# EasyEDA Pro project Daaga1.3V.epro

# Schematic Daaga1.3V
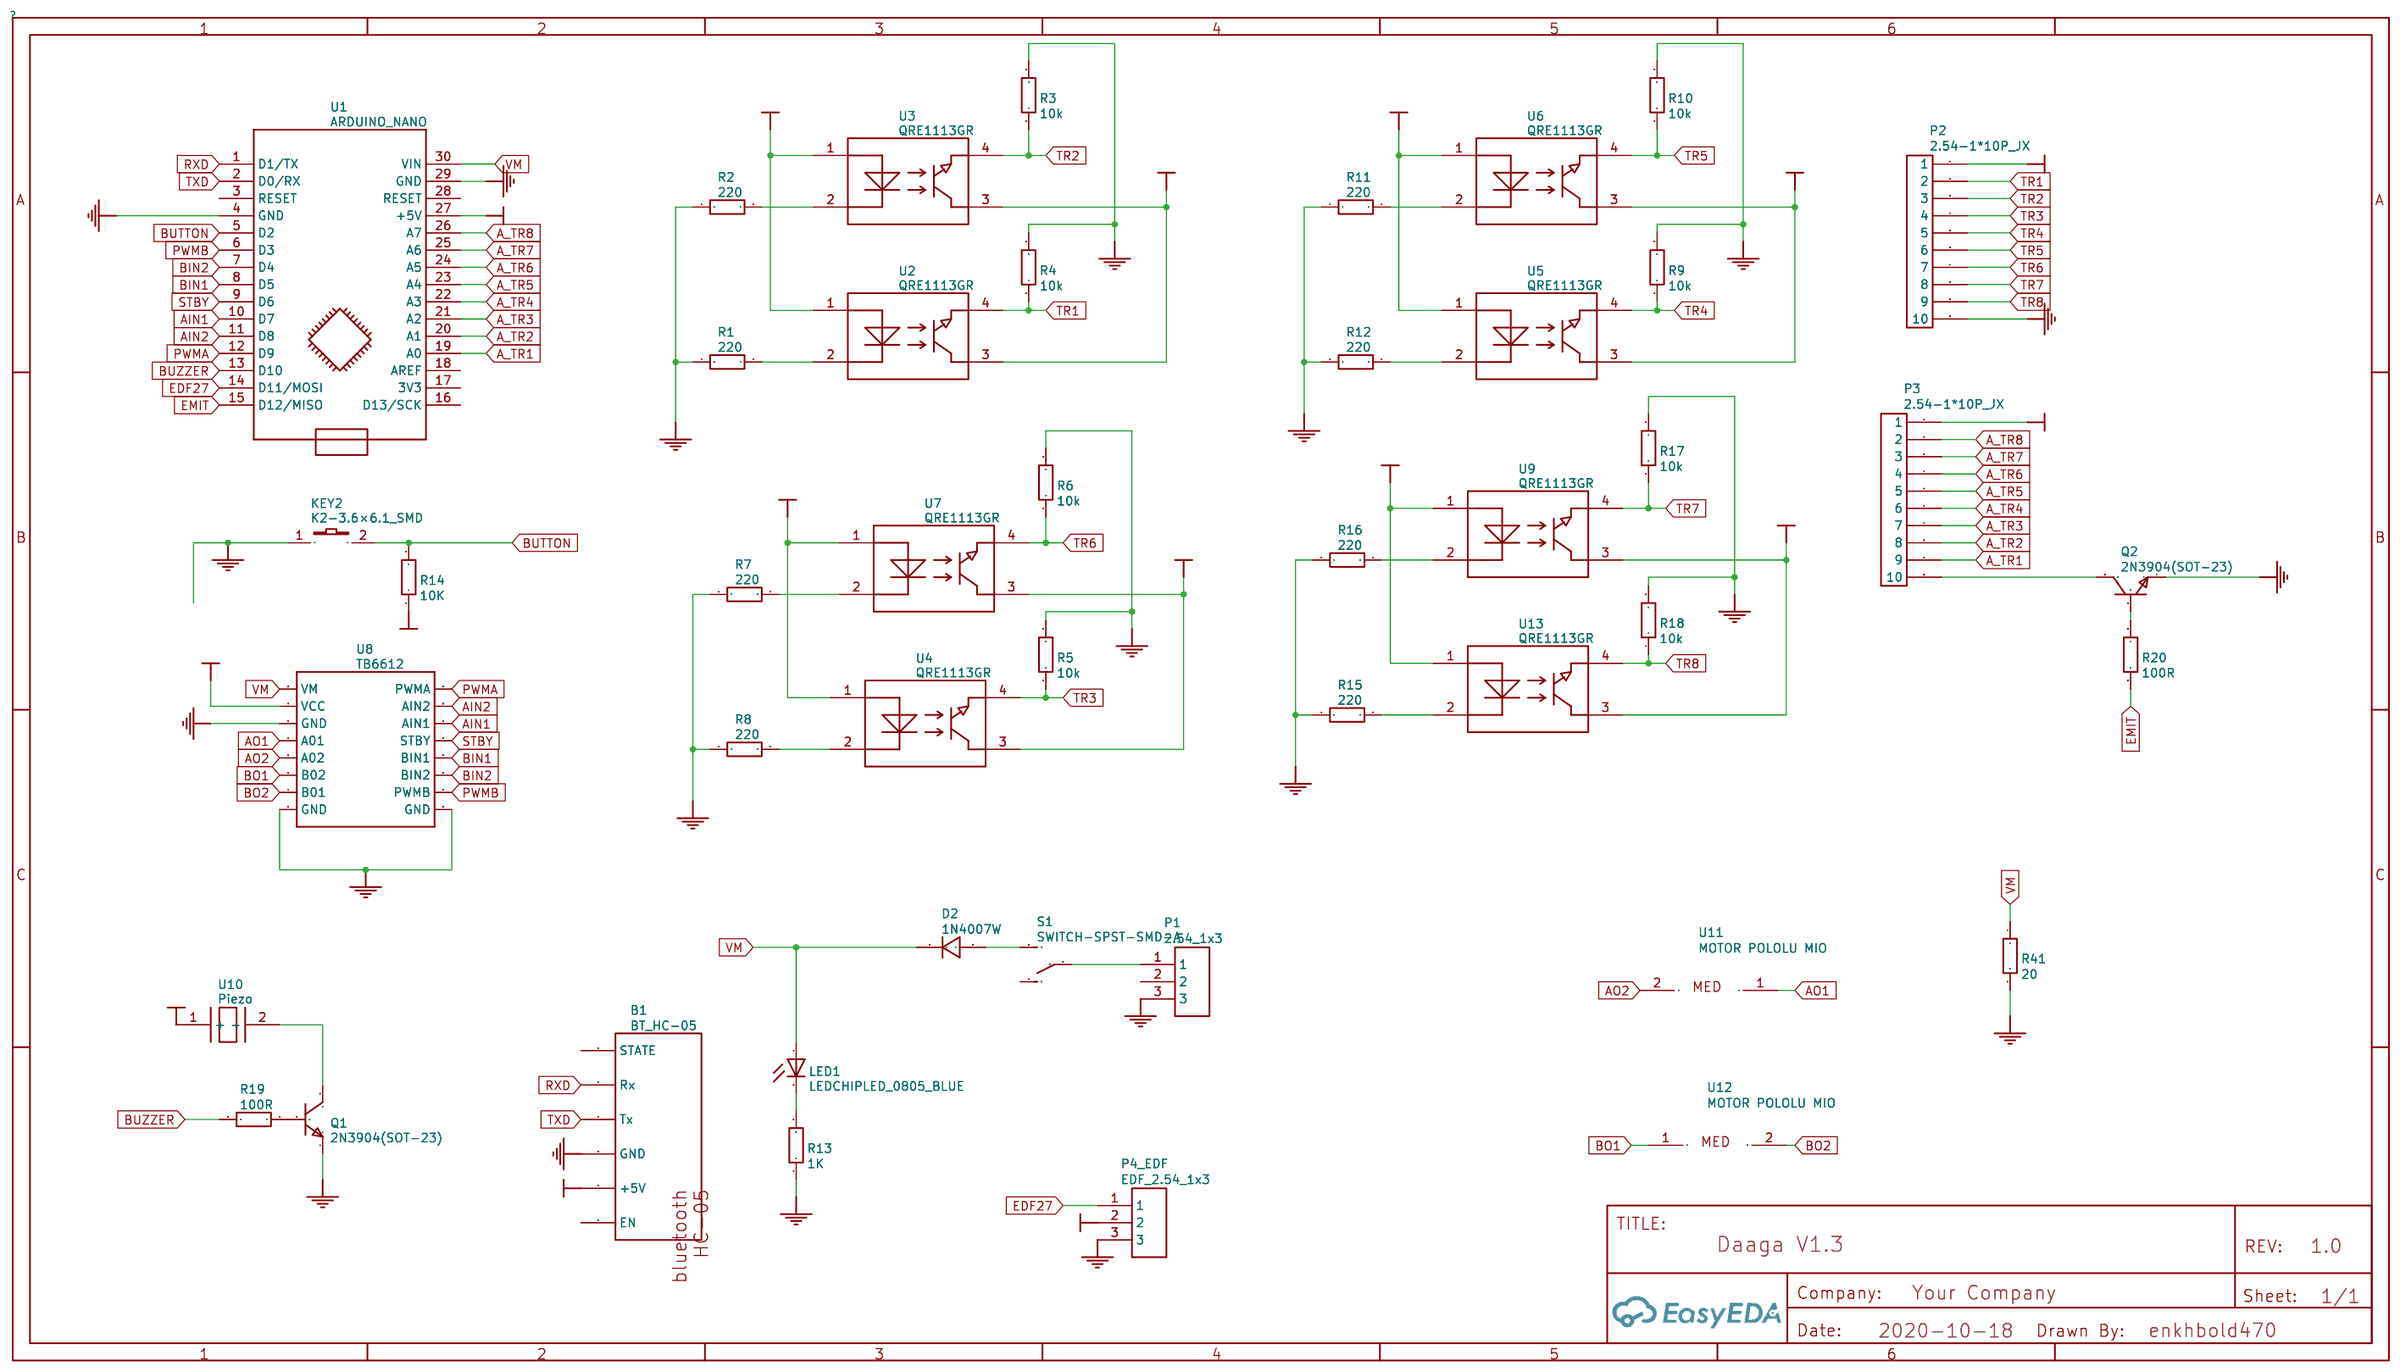
[diagram p0: schematic sheet]

## Parts
B1  BT_HC-05  [BT_HC05_VERTICAL_UP]
D2  1N4007W  [DIODE 0.4]
KEY2  K2-3.6×6.1_SMD  [BUTTON]
LED1  LEDCHIPLED_0805_BLUE  [CHIPLED_0805]
P1  2.54_1x3  [HDR-3X1/2.54]
P2  2.54-1*10P_JX  [2.54-1*10P_TIGHT_JX]
P3  2.54-1*10P_JX  [2.54-1*10P_TIGHT_JX]
P4_EDF  EDF_2.54_1x3  [HDR-3X1/2.54]
Q1  2N3904(SOT-23)  [SOT-23-3_L2.9-W1.3-P1.90-LS2.4-TR]
Q2  2N3904(SOT-23)  [SOT-23-3_L2.9-W1.3-P1.90-LS2.4-TR]
R1  220  [R0805]
R2  220  [R0805]
R3  10k  [R0805]
R4  10k  [R0805]
R5  10k  [R0805]
R6  10k  [R0805]
R7  220  [R0805]
R8  220  [R0805]
R9  10k  [R0805]
R10  10k  [R0805]
R11  220  [R0805]
R12  220  [R0805]
R13  1K  [R0805]
R14  10K  [R0805]
R15  220  [R0805]
R16  220  [R0805]
R17  10k  [R0805]
R18  10k  [R0805]
R19  100R  [R0805]
R20  100R  [R0805]
R41  20  [R2010]
S1  SWITCH-SPST-SMD-A  [SWITCH-SK12D07VG3]
U1  ARDUINO_NANO  [ARDUINO_NANO]
U2  QRE1113GR  [QRE1113]
U3  QRE1113GR  [QRE1113]
U4  QRE1113GR  [QRE1113]
U5  QRE1113GR  [QRE1113]
U6  QRE1113GR  [QRE1113]
U7  QRE1113GR  [QRE1113]
U8  TB6612  [DUAL TB6612FNG]
U9  QRE1113GR  [QRE1113]
U10  Piezo  [PIEZO]
U11  MOTOR POLOLU MIO  [BRACKET MOTOR POLOLU N20]
U12  MOTOR POLOLU MIO  [BRACKET MOTOR POLOLU N20]
U13  QRE1113GR  [QRE1113]

## Library data of the parts
B1 = BT_HC-05: Contributor: DavyVaes; spicePre: B
D2 = 1N4007W: Supplier: LCSC; Supplier Part: C328592; Manufacturer: BLUE ROCKET; Contributor: LCEDA_Lib; spicePre: D
KEY2 = K2-1107ST-A4SW-06: Supplier Part: C118141; Supplier: LCSC; 制造商: 韩国韩荣; Contributor: LCEDA_Lib; spicePre: K
LED1 = LEDCHIPLED_0805_BLUE: Contributor: Adafruit; spicePre: L; spiceSymbolName: LEDCHIPLED_0805
P1 = Header-Male-2.54_1x3: EasyEDA: C49257; Supplier Part: C49257; Supplier: EasyEDA; Manufacturer: EasyEDA; spicePre: P
P2 P3 = 2.54-1*10P_JX: Supplier Part: C115245; Supplier: LCSC; spicePre: P
P4_EDF = Header-Male-2.54_1x3: EasyEDA: C49257; Supplier Part: C49257; Supplier: EasyEDA; Manufacturer: EasyEDA; spicePre: P; spiceSymbolName: 2.54_1x3
Q1 Q2 = 2n3904S-RTK/PS: Supplier: LCSC; Manufacturer: KEC; Supplier Part: C18536; JLCPCB Part Class: SOT-23; Contributor: LCEDA_Lib; spicePre: Q
R1 R2 R4 R6 R9-R20 = CR0805F87150G: Supplier: LCSC; Supplier Part: C101848; Manufacturer: LIZ Elec; nameAlias: Resistance (Ohms); Contributor: LCSC; spicePre: R; Package Display: No
R3 R5 R7 R8 = CR0805F87150G: Supplier: LCSC; Supplier Part: C101848; Manufacturer: LIZ Elec; nameAlias: Resistance (Ohms); Contributor: LCSC; spicePre: R
R41 = CR2010J20RE04: Supplier: LCSC; Supplier Part: C245670; Manufacturer: Ever Ohms Tech; nameAlias: Resistance (Ohms); Contributor: LCSC; spicePre: R
S1 = SWITCH-SPST-SMD-A: Contributor: Pinoccio; spicePre: S
U1 = ARDUINO_NANO: sourceId: KGSeAWhDB; timeStamp: 1452340004; spicePre: U
U2 U3 U7 = QRE1113GR: Supplier: LCSC; Supplier Part: C232862; Manufacturer: ON Semicon; JLCPCB Part Class: Extend; Contributor: LCSC; spicePre: U
U4-U6 U9 U13 = QRE1113GR: Supplier: LCSC; Supplier Part: C232862; Manufacturer: ON Semicon; JLCPCB Part Class: Extend; Contributor: LCSC; spicePre: U; Package Display: No
U8 = TB6612: timeStamp: 1463550914; Contributor: Joab Silva; spicePre: U
U10 = Piezo: nameAlias: Model; spicePre: X; Contributor: Thasan; timeStamp: 1449699030; sourceId: AGuTfBXVh
U11 U12 = MOTOR POLOLU MIO: Manufacturer: POLOLU; Contributor: PiterSantaCruz; spicePre: U

## Nets
GND: B1.3(GND) KEY2.1 P1.3 P4_EDF.3 Q1.1(E) Q2.1(E) R13.1 R41.2 U1.4(GND) U1.29(GND) U8.3(GND) U8.8(GND) U8.9(GND)
VCC: B1.2(+5V) P3.1 P4_EDF.2 R14.1 U1.27(+5V) U8.2(VCC) U10.1(+)
A_TR1: P3.9 U1.19(A0)
A_TR2: P3.8 U1.20(A1)
A_TR3: P3.7 U1.21(A2)
A_TR4: P3.6 U1.22(A3)
A_TR5: P3.5 U1.23(A4)
A_TR6: P3.4 U1.24(A5)
A_TR7: P3.3 U1.25(A6)
A_TR8: P3.2 U1.26(A7)
AIN1: U1.10(D7) U8.14(AIN1)
AIN2: U1.11(D8) U8.15(AIN2)
AO1: U8.4(A01) U11.1
AO2: U8.5(A02) U11.2
BIN1: U1.8(D5) U8.12(BIN1)
BIN2: U1.7(D4) U8.11(BIN2)
BO1: U8.6(B02) U12.1
BO2: U8.7(B01) U12.2
BUTTON: KEY2.2 R14.2 U1.5(D2)
BUZZER: R19.2 U1.13(D10)
C_GND: P2.10 R1.1 R2.1 R3.2 R4.2 R5.2 R6.2 R7.1 R8.1 R9.2 R10.2 R11.1 R12.1 R15.1 R16.1 R17.2 R18.2
C_VCC: P2.1 U2.1 U2.3 U3.1 U3.3 U4.1 U4.3 U5.1 U5.3 U6.1 U6.3 U7.1 U7.3 U9.1 U9.3 U13.1 U13.3
EDF27: P4_EDF.1 U1.14(D11/MOSI)
EMIT: R20.2 U1.15(D12/MISO)
PWMA: U1.12(D9) U8.16(PWMA)
PWMB: U1.6(D3) U8.10(PWMB)
RXD: B1.5(Rx) U1.1(D1/TX)
STBY: U1.9(D6) U8.13(STBY)
TR1: P2.2 R4.1 U2.4
TR2: P2.3 R3.1 U3.4
TR3: P2.4 R5.1 U4.4
TR4: P2.5 R9.1 U5.4
TR5: P2.6 R10.1 U6.4
TR6: P2.7 R6.1 U7.4
TR7: P2.8 R17.1 U9.4
TR8: P2.9 R18.1 U13.4
TXD: B1.4(Tx) U1.2(D0/RX)
VM: D2.1 LED1.A R41.1 U1.30(VIN) U8.1(VM)
D2_2: D2.2 S1.3(S)
P1_1: P1.1 S1.2(P)
P3_10: P3.10 Q2.3(C)
Q1_2: Q1.2(B) R19.1
Q1_3: Q1.3(C) U10.2(-)
Q2_2: Q2.2(B) R20.1
R11_2: R11.2 U6.2
R12_2: R12.2 U5.2
R13_2: LED1.C R13.2
U2_2: R1.2 U2.2
U3_2: R2.2 U3.2
U4_2: R8.2 U4.2
U7_2: R7.2 U7.2
U9_2: R16.2 U9.2
U13_2: R15.2 U13.2

Not connected (* = marked no-connect by the designer): B1 1(EN) 6(STATE); P1 2; S1 1(O); U1 3(RESET) 16(D13/SCK) 17(3V3) 18(AREF) 28(RESET)

# Board PCB_2020-10-18_20-24-53
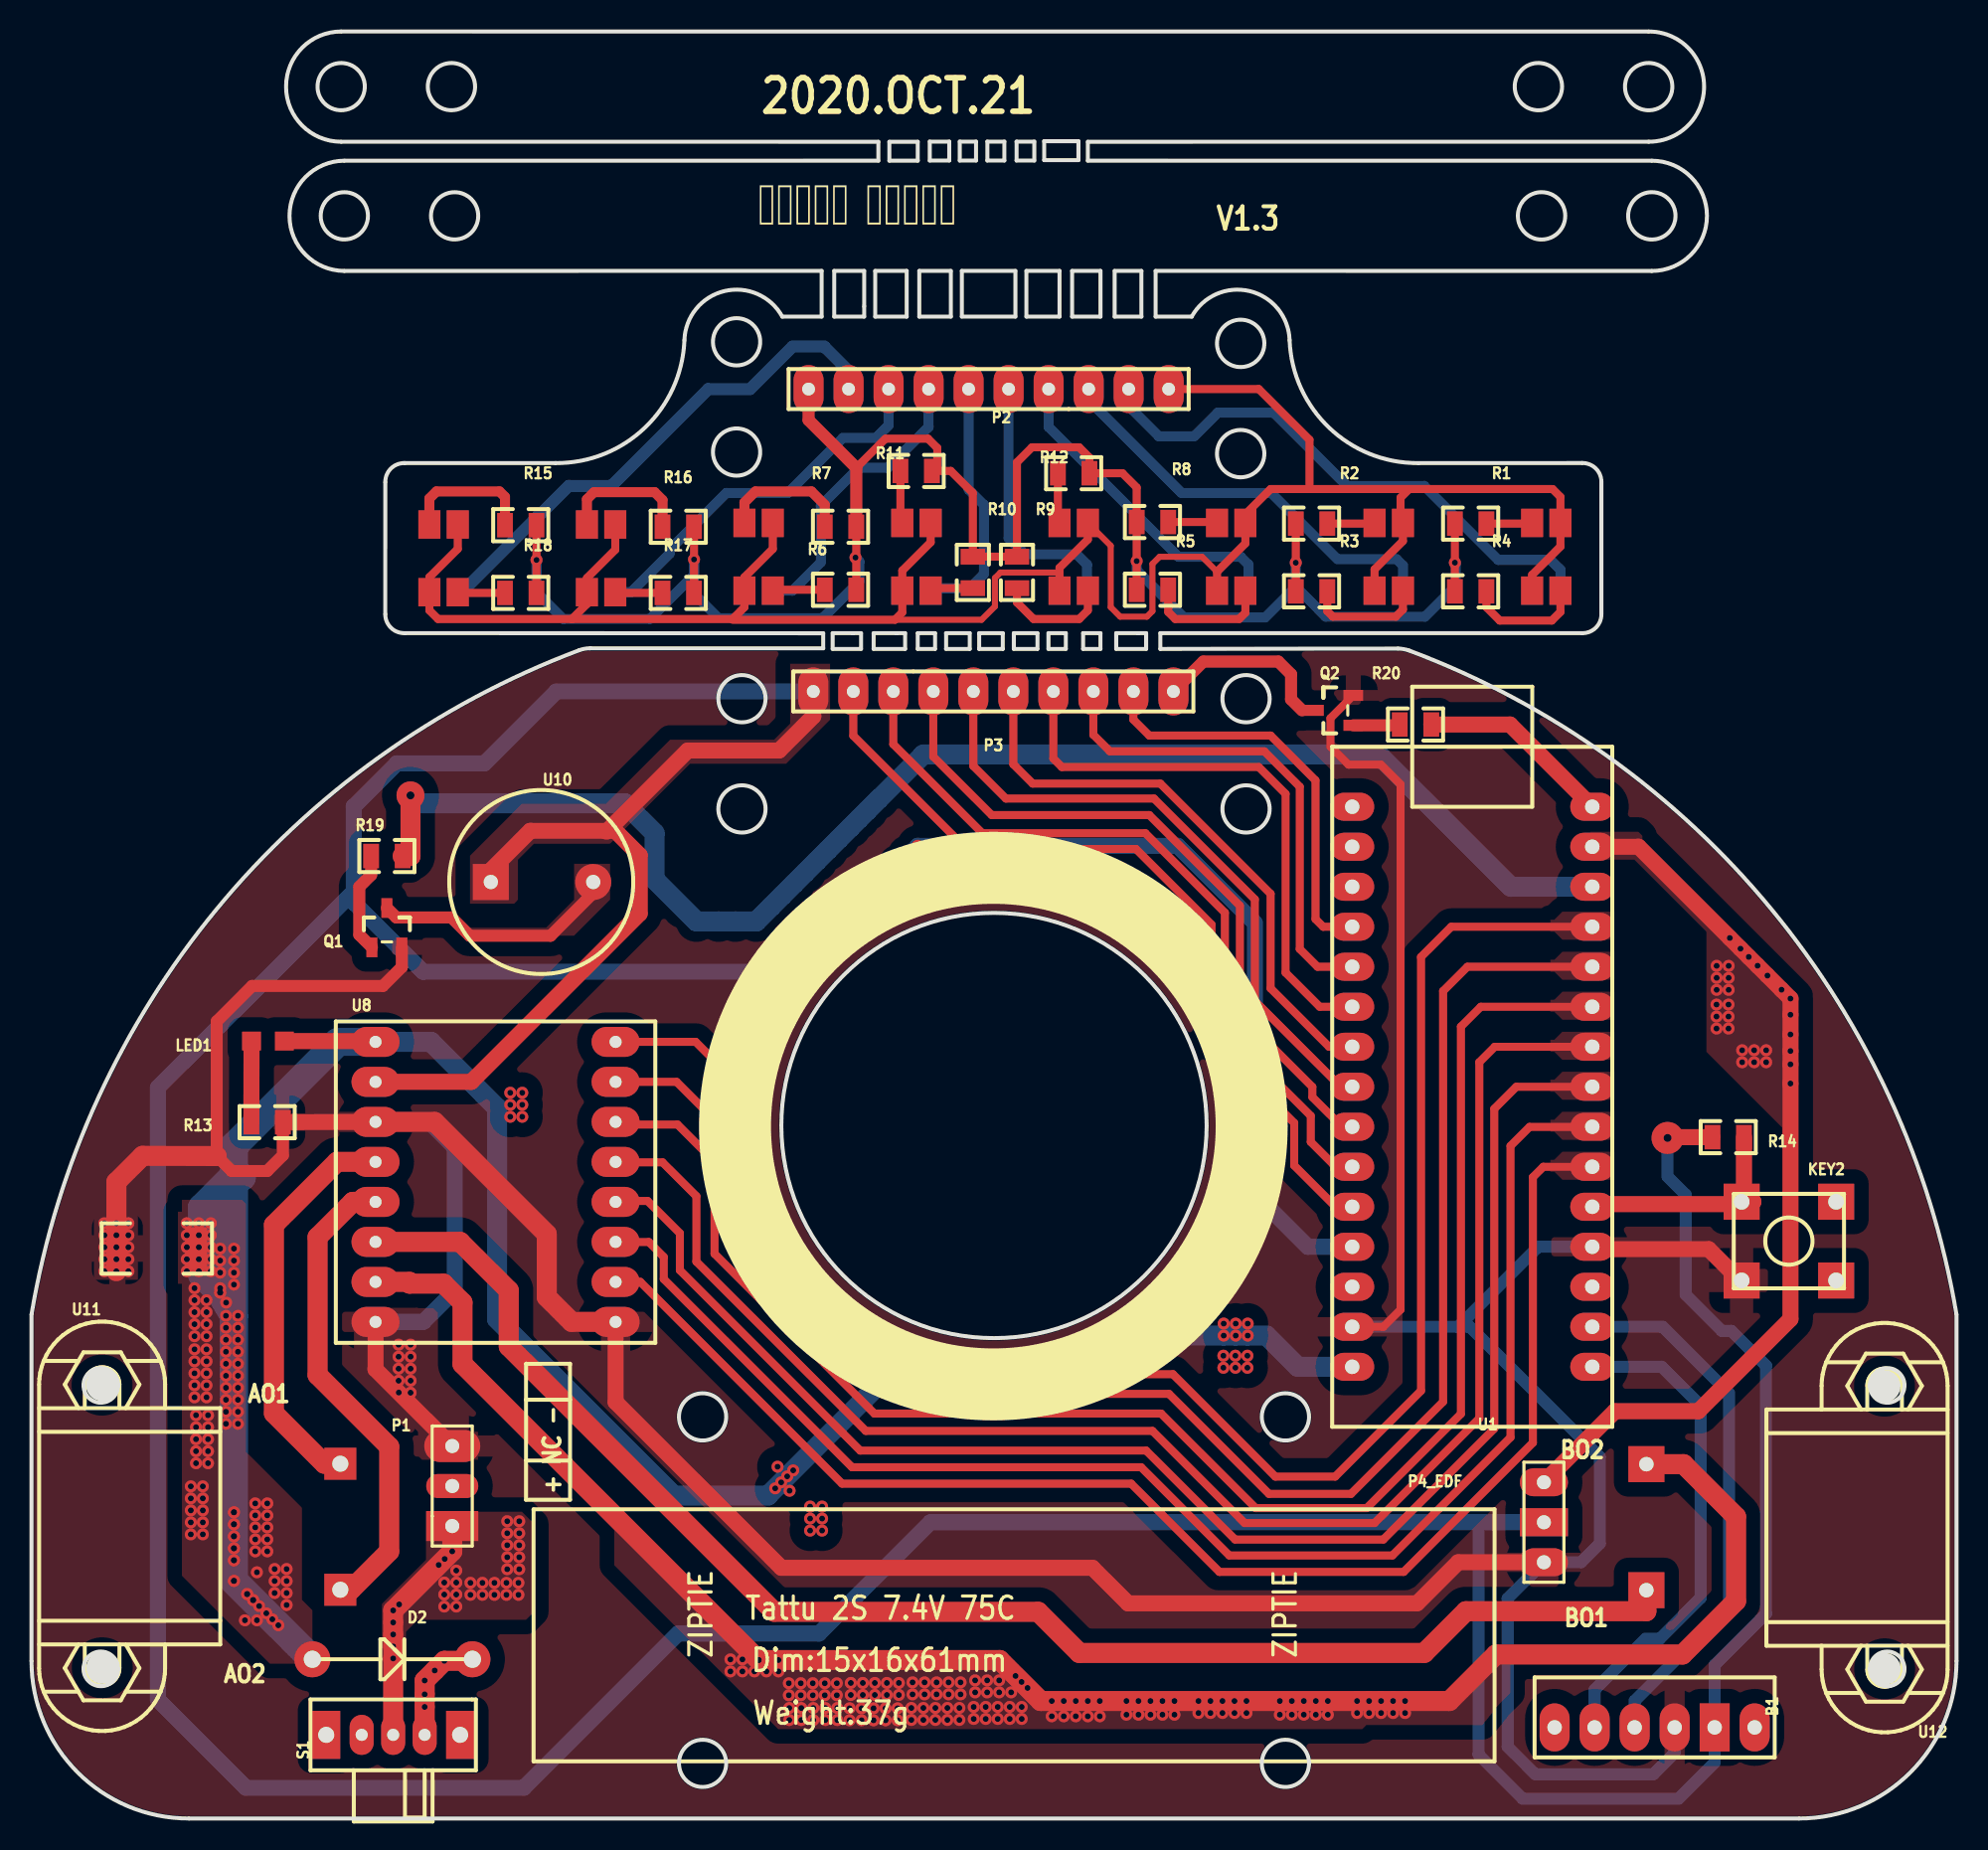
[diagram p1: board, top side]
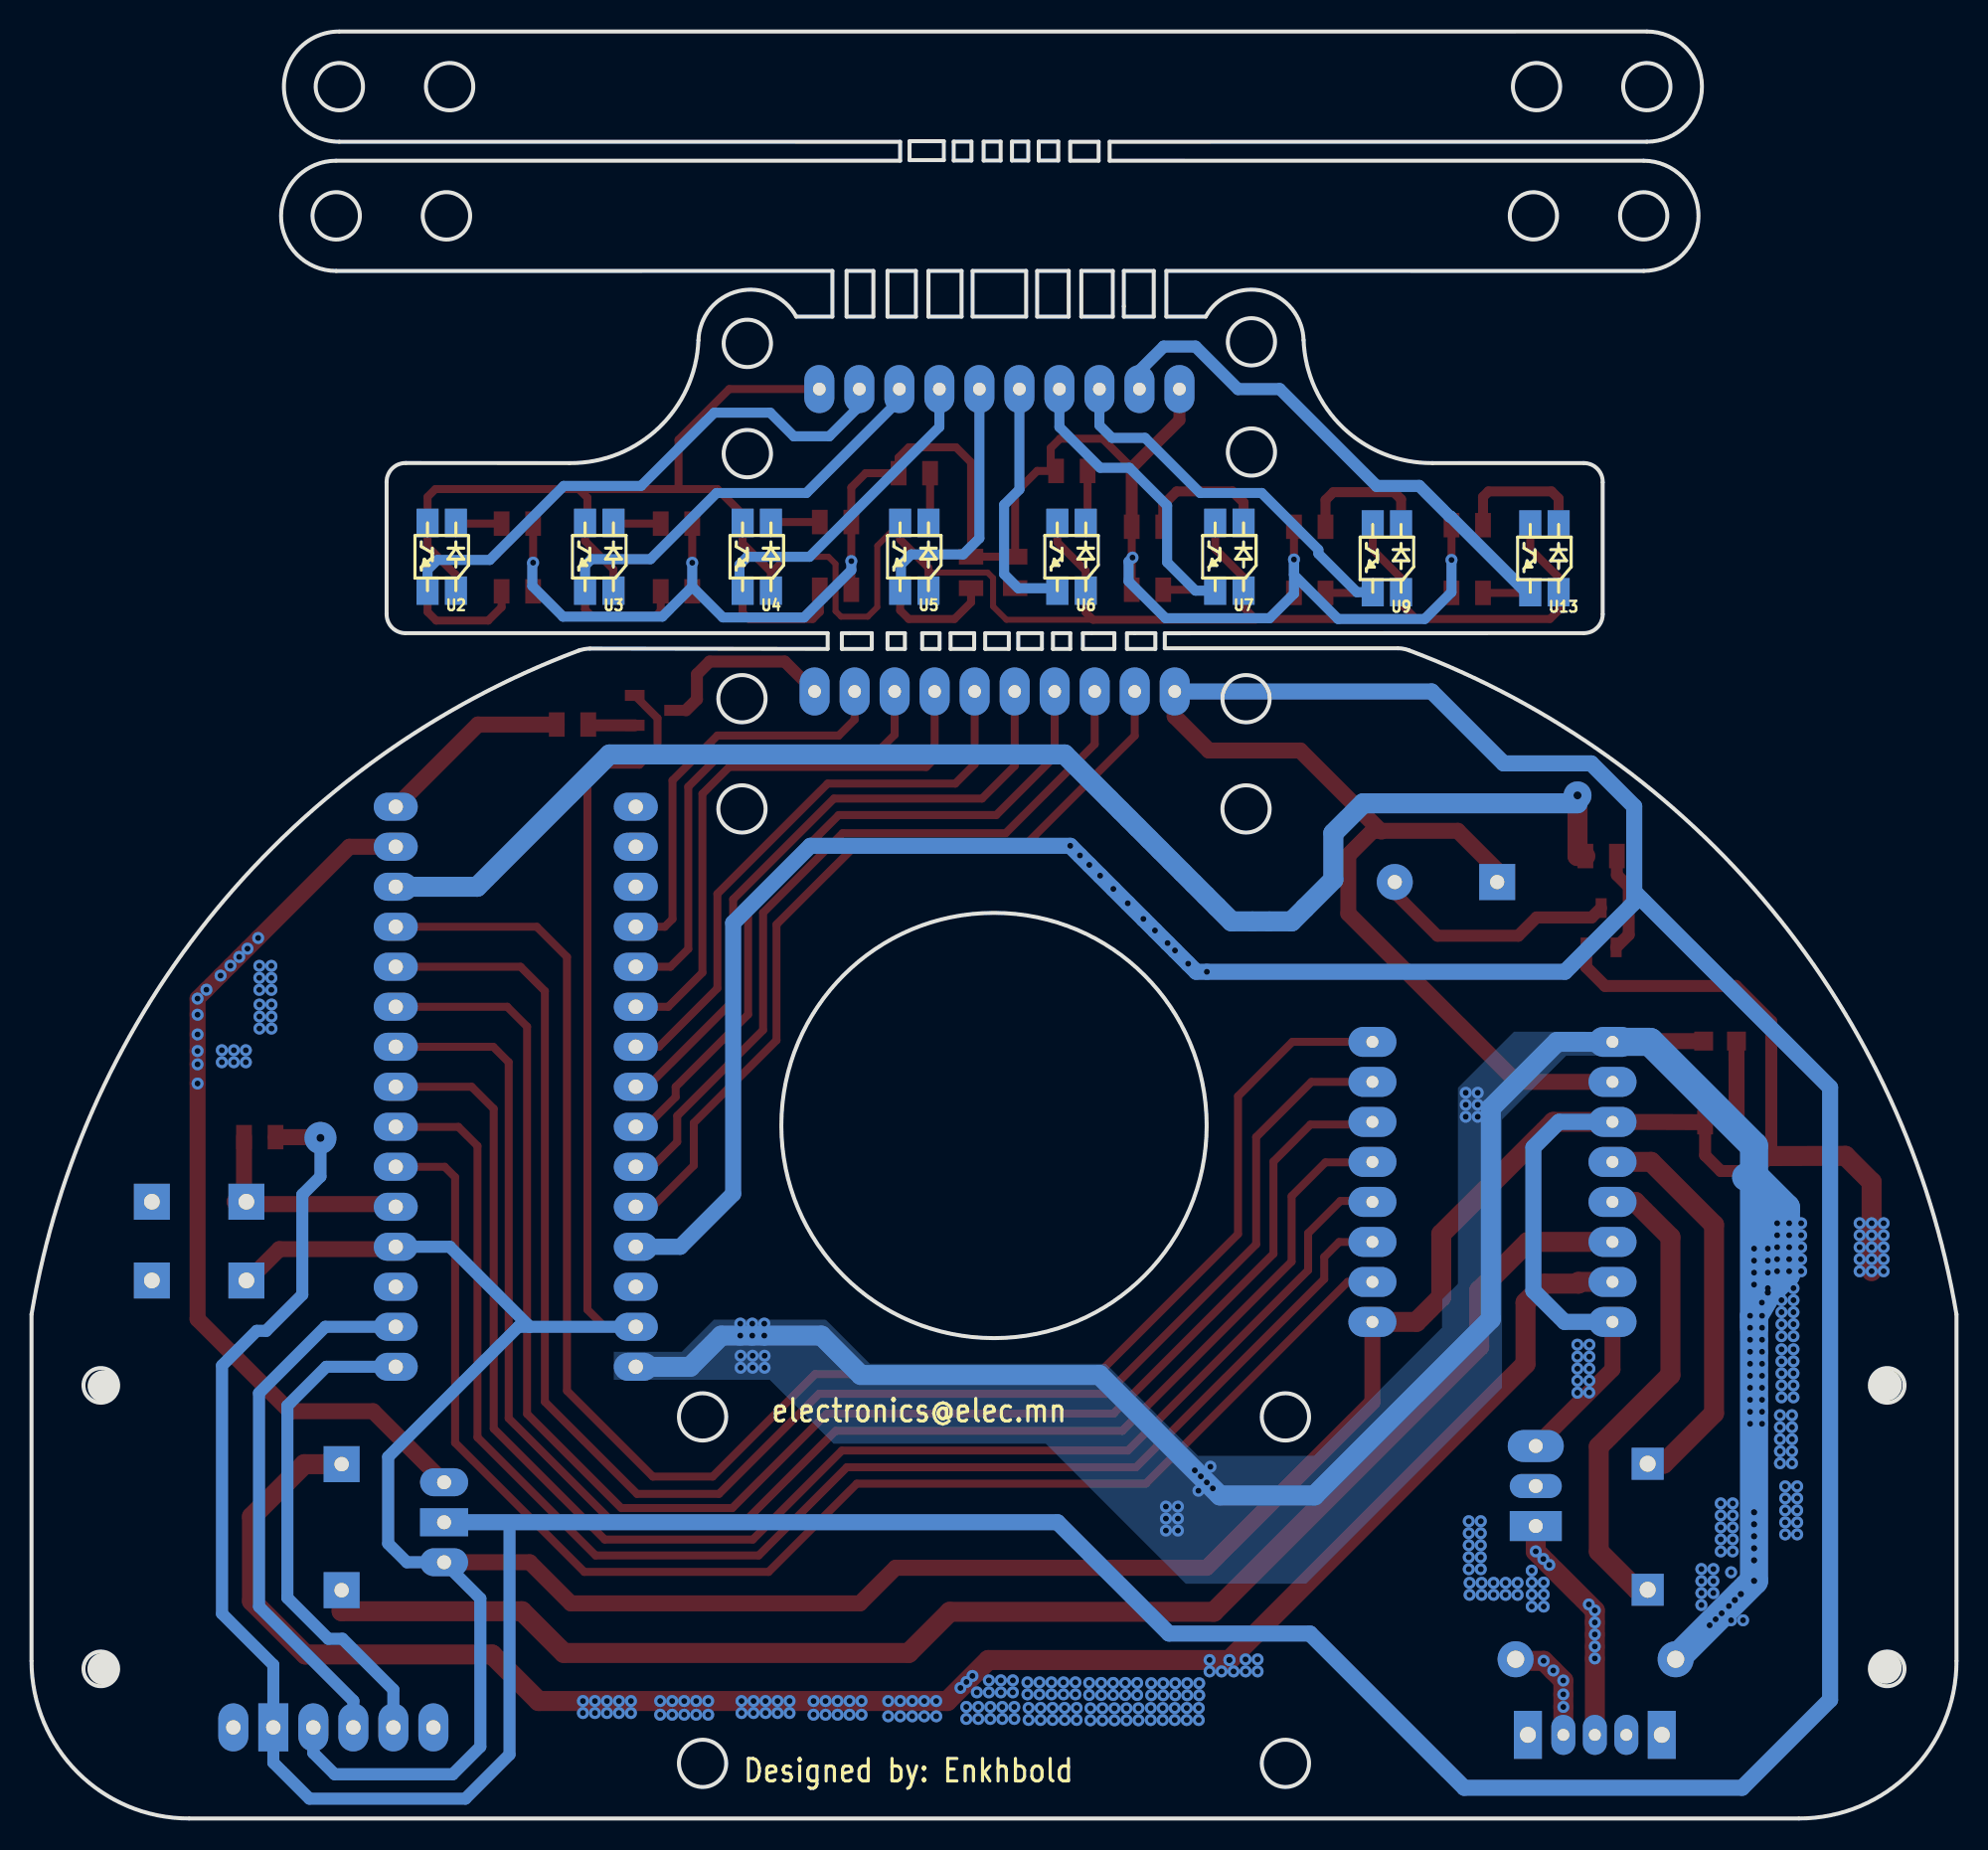
[diagram p2: board, bottom side, seen from below]

Outline 122.2 x 113.46 mm; copper layers: Top Layer, Bottom Layer. Coordinates in mm from the lower left corner of the outline.
Outline path: circle c4.4,27.5 r1.1 ; circle c4.4,9.5 r1.1 ; circle c19.66,109.96 r1.5 ; circle c19.86,101.76 r1.5 ; circle c26.66,109.96 r1.5 ; circle c26.86,101.76 r1.5 ; circle c42.6,25.5 r1.5 ; circle c42.6,3.5 r1.5 ; circle c44.76,93.76 r1.5 ; circle c44.76,86.76 r1.5 ; circle c45.1,71.1 r1.5 ; circle c45.1,64.1 r1.5 ; circle c61.1,44 r13.5 ; circle c76.76,93.66 r1.5 ; circle c76.76,86.66 r1.5 ; circle c77.1,71.1 r1.5 ; circle c77.1,64.1 r1.5 ; circle c79.6,25.5 r1.5 ; circle c79.6,3.5 r1.5 ; circle c95.66,109.96 r1.5 ; circle c95.86,101.76 r1.5 ; circle c102.66,109.96 r1.5 ; circle c102.86,101.76 r1.5 ; circle c117.8,27.5 r1.1 ; circle c117.8,9.5 r1.1 ; 0,32 0,10 arc(2.93,2.93) 10,0 112.2,0 arc(119.27,2.93) 122.2,10 122.2,32 arc(110.45,57.73) 87.44,74.16 arc(87.1,74.25) 86.75,74.28 71.66,74.26 71.66,75.26 98.45,75.26 arc(99.31,75.62) 99.66,76.48 99.66,84.86 arc(99.3,85.72) 98.44,86.06 88.05,86.06 arc(82.38,88.3) 79.86,93.86 arc(77.33,96.98) 73.65,95.36 71.36,95.36 71.36,98.26 102.86,98.26 arc(106.36,101.76) 102.86,105.26 67.06,105.26 67.06,106.46 102.66,106.46 arc(106.16,109.96) 102.66,113.46 19.66,113.46 arc(16.16,109.96) 19.66,106.46 53.76,106.46 53.76,105.26 19.86,105.26 arc(16.36,101.76) 19.86,98.26 50.16,98.26 50.16,95.36 47.66,95.36 arc(43.98,96.98) 41.45,93.86 arc(38.93,88.3) 33.26,86.06 23.66,86.06 arc(22.8,85.7) 22.46,84.84 22.46,76.46 arc(22.82,75.61) 23.68,75.26 50.26,75.25 50.26,74.3 35.46,74.3 arc(35.1,74.27) 34.76,74.17 arc(11.75,57.73) 0,32 ; 50.86,75.26 50.86,74.26 52.66,74.26 52.66,75.26 50.86,75.26 ; 50.96,98.26 50.96,95.36 52.86,95.36 52.86,98.26 50.96,98.26 ; 53.46,75.26 53.46,74.26 55.46,74.26 55.46,75.26 53.46,75.26 ; 53.56,98.26 53.56,95.36 55.56,95.36 55.56,98.26 53.56,98.26 ; 54.46,106.46 54.46,105.26 56.26,105.26 56.26,106.46 54.46,106.46 ; 56.26,75.26 56.26,74.26 57.36,74.26 57.36,75.26 56.26,75.26 ; 56.36,98.26 56.36,95.36 58.36,95.36 58.36,98.26 56.36,98.26 ; 57.02,106.47 57.02,105.27 58.26,105.27 58.26,106.47 57.02,106.47 ; 58.06,75.26 58.06,74.26 59.56,74.26 59.56,75.26 58.06,75.26 ; 58.93,106.47 58.93,105.27 59.96,105.27 59.96,106.47 58.93,106.47 ; 59.06,98.26 59.06,95.36 62.46,95.36 62.46,98.26 59.06,98.26 ; 60.16,75.26 60.16,74.26 61.66,74.26 61.66,75.26 60.16,75.26 ; 60.68,106.47 60.68,105.27 61.76,105.27 61.76,106.47 60.68,106.47 ; 62.36,75.26 62.36,74.26 63.86,74.26 63.86,75.26 62.36,75.26 ; 62.53,106.47 62.53,105.27 63.66,105.27 63.66,106.47 62.53,106.47 ; 63.16,98.26 63.16,95.36 65.26,95.36 65.26,98.26 63.16,98.26 ; 64.29,106.5 64.29,105.3 66.46,105.3 66.46,106.5 64.29,106.5 ; 64.56,75.26 64.56,74.26 65.66,74.26 65.66,75.26 64.56,75.26 ; 66.06,98.26 66.06,95.36 67.86,95.36 67.86,98.26 66.06,98.26 ; 66.76,75.26 66.76,74.26 67.86,74.26 67.86,75.26 66.76,75.26 ; 68.76,98.26 68.76,95.36 70.46,95.36 70.46,98.26 68.76,98.26 ; 68.86,75.26 68.86,74.26 70.76,74.26 70.76,75.26 68.86,75.26

## Design rules (mm)
via Default (default): diameter min 0.61, default 0.61, max 100.025; hole min 0.305, default 0.305, max 59.995
pour e216 uses gge17359
pour e775 uses gge17359(1)

## Placement (name value [footprint] x y rotation side)
B1  BT_HC-05  [BT_HC05_VERTICAL_UP]  110.66 8.96 270 top
D2  1N4007W  [DIODE 0.4]  22.91 10.11 0 top
KEY2  K2-3.6×6.1_SMD  [BUTTON]  108.56 34.16 90 top
LED1  LEDCHIPLED_0805_BLUE  [CHIPLED_0805]  15.01 49.36 90 top
P1  2.54_1x3  [HDR-3X1/2.54#2]  26.71 21.11 90 top
P2  2.54-1*10P_JX  [2.54-1*10P_TIGHT_JX]  60.76 90.76 180 top
P3  2.54-1*10P_JX  [2.54-1*10P_TIGHT_JX]  61.06 71.56 0 top
P4_EDF  EDF_2.54_1x3  [HDR-3X1/2.54]  96.01 18.81 270 top
Q1  2N3904(SOT-23)  [SOT-23-3_L2.9-W1.3-P1.90-LS2.4-TR]  22.56 56.56 270 top
Q2  2N3904(SOT-23)  [SOT-23-3_L2.9-W1.3-P1.90-LS2.4-TR]  82.66 70.36 0 top
R1  220  [R0805]  91.36 82.22 0 top
R2  220  [R0805]  81.26 82.22 0 top
R3  10k  [R0805]  81.26 77.92 180 top
R4  10k  [R0805]  91.36 77.92 180 top
R5  10k  [R0805]  71.16 78.02 180 top
R6  10k  [R0805]  51.36 78.02 0 top
R7  220  [R0805]  51.36 82.02 180 top
R8  220  [R0805]  71.16 82.32 0 top
R9  10k  [R0805]  62.56 79.12 90 top
R10  10k  [R0805]  59.76 79.12 90 top
R11  220  [R0805]  56.16 85.56 180 top
R12  220  [R0805]  66.16 85.42 180 top
R13  1K  [R0805]  14.96 44.21 180 top
R14  10K  [R0805]  107.71 43.26 0 top
R15  220  [R0805]  31.06 82.12 180 top
R16  220  [R0805]  41.06 82.02 180 top
R17  10k  [R0805]  41.06 77.82 0 top
R18  10k  [R0805]  31.06 77.82 0 top
R19  100R  [R0805]  22.56 61.11 0 top
R20  100R  [R0805]  87.86 69.46 0 top
R41  20  [R2010]  7.95 36.19 180 top
S1  SWITCH-SPST-SMD-A  [SWITCH-SK12D07VG3]  22.96 5.31 90 top
U1  -  [ARDUINO_NANO]  91.46 46.46 180 top
U2  QRE1113GR  [QRE1113]  94.46 81.46 0 bottom
U3  QRE1113GR  [QRE1113]  84.46 81.46 0 bottom
U4  QRE1113GR  [QRE1113]  74.46 81.46 0 bottom
U5  QRE1113GR  [QRE1113]  64.46 81.46 0 bottom
U6  QRE1113GR  [QRE1113]  54.48 81.46 0 bottom
U7  QRE1113GR  [QRE1113]  44.46 81.46 0 bottom
U8  TB6612  [DUAL TB6612FNG]  29.46 49.31 0 top
U9  QRE1113GR  [QRE1113]  34.46 81.36 0 bottom
U10  Piezo  [PIEZO]  32.36 59.46 0 top
U11  MOTOR POLOLU MIO  [BRACKET MOTOR POLOLU N20]  2.46 18.46 0 top
U12  MOTOR POLOLU MIO  [BRACKET MOTOR POLOLU N20#2]  119.66 18.56 180 top
U13  QRE1113GR  [QRE1113]  24.46 81.36 0 bottom

## Footprints (pads in the part's own frame, mm; a bottom-side part is the same pattern mirrored in y, then rotated)
2.54-1*10P_TIGHT_JX
  oval 1.905x3.048 hole 0.81: 1(-11.43,0) 2(-8.89,0) 3(-6.35,0) 4(-3.81,0) 5(-1.27,0) 6(1.27,0) 7(3.81,0) 8(6.35,0) 9(8.89,0) 10(11.43,0)
ARDUINO_NANO
  oval 2.794x1.778 hole 0.914: 1(-7.62,17.78) 2(-7.62,15.24) 3(-7.62,12.7) 4(-7.62,10.16) 5(-7.62,7.62) 6(-7.62,5.08) 7(-7.62,2.54) 8(-7.62,0) 9(-7.62,-2.54) 10(-7.62,-5.08) 11(-7.62,-7.62) 12(-7.62,-10.16) 13(-7.62,-12.7) 14(-7.62,-15.24) 15(-7.62,-17.78) 16(7.62,-17.78) 17(7.62,-15.24) 18(7.62,-12.7) 19(7.62,-10.16) 20(7.62,-7.62) 21(7.62,-5.08) 22(7.62,-2.54) 23(7.62,0) 24(7.62,2.54) 25(7.62,5.08) 26(7.62,7.62) 27(7.62,10.16) 28(7.62,12.7) 29(7.62,15.24) 30(7.62,17.78)
BRACKET MOTOR POLOLU N20
  rect 2.032x2.032 hole 1.016: 1(17.145,4.064) 2(17.145,-3.937)
BRACKET MOTOR POLOLU N20#2
  rect 2.286x2.286 hole 0.914: 1(17.145,4.064) 2(17.145,-3.937)
BT_HC05_VERTICAL_UP
  oval 3.048x1.905 hole 0.914: 1(3.175,-1.27) 3(3.175,-6.35) 4(3.175,-8.89) 5(3.175,-11.43) 6(3.175,-13.97)
  rect 3.048x1.905 hole 0.914: 2(3.175,-3.81)
BUTTON
  rect 2.286x2.286 hole 1: 1(0,0) 2(5,0) 3(5,-6) 4(0,-6)
CHIPLED_0805
  rect 1.199x1.199 smd: A(0,-1.042) C(0,1.042)
DIODE 0.4
  round 2.286 hole 1.092: 1(-5.08,0) 2(5.08,0)
DUAL TB6612FNG
  oval 3.048x1.905 hole 0.762: 1(-7.62,0) 2(-7.62,-2.54) 3(-7.62,-5.08) 4(-7.62,-7.62) 5(-7.62,-10.16) 6(-7.62,-12.7) 7(-7.62,-15.24) 8(-7.62,-17.78) 9(7.62,-17.78) 10(7.62,-15.24) 11(7.62,-12.7) 12(7.62,-10.16) 13(7.62,-7.62) 14(7.62,-5.08) 15(7.62,-2.54) 16(7.62,0)
HDR-3X1/2.54
  oval 1.778x3.048 hole 0.889: 1(-2.54,0) 3(2.54,0)
  rect 1.778x3.048 hole 0.889: 2(0,0)
HDR-3X1/2.54#2
  rect 1.905x3.302 hole 0.889: 1(-2.54,0)
  oval 1.524x3.302 hole 0.889: 2(0,0)
  oval 2.032x3.556 hole 0.889: 3(2.54,0)
PIEZO
  rect 2.286x2.286 hole 0.9: 1(-3.2,0)
  round 2.286 hole 0.9: 2(3.3,0)
QRE1113
  custom 1.4x1.8 hole 0.762x0.767: 1(0.8,3.499) 3(2.6,-0.8)
  custom 1.4x1.8 hole 0.767x0.762: 2(0.8,-0.8) 4(2.6,3.499)
R0805
  rect 1x1.55 smd: 1(-1,0) 2(1,0)
R2010
  rect 1.4x2.7 smd: 1(-2.5,0) 2(2.5,0)
SOT-23-3_L2.9-W1.3-P1.90-LS2.4-TR
  rect 1.25x0.7 smd: 1(1.25,0.95) 2(1.25,-0.95) 3(-1.25,0)
SWITCH-SK12D07VG3
  oval 2.54x1.524 hole 0.762: 1(0,2) 2(0,0) 3(0,-2)
  rect 0x0 hole 1.016: 4(-0.5,4.25) 4(-0.5,-4.25) 4(0.5,4.25) 4(0.5,-4.25)
  rect 3.048x1.778 hole 1.016: 4(0,4.25) 4(0,-4.25)

## Nets
As in the schematic.

Pads without a net: KEY2 3 4; S1 4

## Via types
v1: diameter 0.762, hole 0.381, Top Layer to Bottom Layer, 409 vias
v2: diameter 2.032, hole 0.508, Top Layer to Bottom Layer, 1 via
v3: diameter 1.778, hole 0.508, Top Layer to Bottom Layer, 1 via

## Routing (per net, layer and track width the routed paths; a pad name or vN(x,y) marks a point on that pad's centre or on a via; arc(x,y) is an arc through that point)
GND: length 294.5
  Top Layer w0.508: U1.29 85.82,31.22 86.91,32.31 86.91,65.66 85.66,66.91 83.61,66.91 82.46,68.06 82.46,69.86 83.91,71.31
  Top Layer w0.762: 15.96,44.21 15.96,42.11 14.96,41.11 12.71,41.11 11.76,42.06 11.76,50.61 14.01,52.86 22.31,52.86 23.51,54.06 23.51,55.31
  Top Layer w1.016: U8.8 21.84,28.52 P1.3 ; 99.13,36.15 106.47,36.15 108.61,34.01 ; 37.08,31.53 37.08,26.44 47.6,15.92 67.35,15.92 69.61,13.66 87.96,13.66 90.57,16.27 96.01,16.27 ; 21.84,44.23 15.96,44.21
  Top Layer w1.27: 11.76,42.06 7.05,42.08 5.39,40.41 5.39,34.75 ; U8.9 34.29,31.53 32.71,33.11 32.71,37.11 25.59,44.23 U8.3
  Bottom Layer w0.762: 104.31,5.79 104.31,4.16 102.96,2.81 95.46,2.81 93.71,4.56 93.71,13.97 96.01,16.27 98.37,16.27 99.56,17.46 99.56,22.96 91.3,31.22 90.57,31.22 ; U1.29 90.57,31.22 95.65,36.3 U1.4
  Bottom Layer w1.016: 21.84,31.53 24.88,31.53 26.86,33.51 26.86,42.61 25.24,44.23 21.84,44.23
  vias: v1(4.62,37.79) v1(4.62,37.03) v1(4.62,36.27) v1(4.62,35.51) v1(4.62,34.75) v1(5.39,37.79) v1(5.39,37.03) v1(5.39,36.27) v1(5.39,35.51) v1(5.39,34.75) v1(6.15,37.79) v1(6.15,37.03) v1(6.15,36.27) v1(6.15,35.51) v1(6.15,34.75) v1(23.3,30.08) v1(23.3,29.32) v1(23.3,28.56) v1(23.3,27.8) v1(23.31,27.05) v1(24.06,30.08) v1(24.06,29.32) v1(24.06,28.56) v1(24.06,27.8) v1(24.06,27.03)
VCC: length 414.3
  Top Layer w1.016: R14.1 103.91,43.26 v2(103.86,43.21) ; 21.84,46.77 27.92,46.77 38.61,57.46 38.61,61.16 37.06,62.71 31.66,62.71 29.16,60.21 29.16,59.46 ; P3.1 49.63,69.98 47.46,67.81 41.66,67.81 36.51,62.66
  Bottom Layer w0.762: v2(103.86,43.21) 103.86,40.76 105.01,39.61 105.01,33.26 107.31,30.96 107.91,30.96 110.11,28.76 110.11,13.01 106.85,9.75 106.85,3.55 104.56,1.26 94.66,1.26 91.86,4.06 91.86,18.81
  Bottom Layer w1.016: 96.01,18.81 57.06,18.81 49.99,11.74 41.04,11.74 31.24,1.95 13.61,1.95 8.02,7.54 8.02,46.41 20.46,58.84 ; 49.63,71.56 33.32,71.56 28.75,66.99 23.19,66.99 20.46,64.26 20.46,58.16 24.86,53.76 v1(47.59,53.76) 48.26,53.76 v1(48.77,54.28) v1(49.61,55.11) v1(50.08,55.58) v1(50.88,56.38) v1(51.62,57.12) v1(52.61,58.11) 53.52,59.02 v1(54.36,59.86) v1(55.64,61.15) v1(56.26,61.76) 72.76,61.76 77.66,56.86 77.66,39.66 81.02,36.3 U1.27
  vias: v1(53.52,59.02) v1(55.05,60.55)
A_TR1: length 26.3
  Top Layer w0.508: 69.95,71.56 69.95,69.77 70.96,68.76 78.66,68.76 81.51,65.91 81.51,57.11 82,56.62 U1.19
A_TR2: length 31.3
  Top Layer w0.508: 67.41,71.56 67.41,68.81 68.46,67.76 78.26,67.76 80.51,65.51 80.51,55.21 81.64,54.08 U1.20
A_TR3: length 36.4
  Top Layer w0.508: U1.21 81.78,51.54 79.61,53.71 79.61,65.06 77.91,66.76 65.41,66.76 64.87,67.3 64.87,71.56
A_TR4: length 37.1
  Top Layer w0.508: 62.33,71.56 62.33,66.94 63.56,65.71 71.66,65.71 78.66,58.71 78.66,52.71 82.37,49 U1.22
A_TR5: length 41
  Top Layer w0.508: U1.23 83.11,46.46 77.66,51.91 77.66,58.36 71.26,64.76 61.86,64.76 59.79,66.83 59.79,71.56
A_TR6: length 44.9
  Top Layer w0.508: 57.25,71.56 57.25,67.42 60.96,63.71 70.96,63.71 76.71,57.96 76.71,51.05 81.31,46.45 81.31,45.81 83,44.11 83.64,44.11 U1.24
A_TR7: length 48.9
  Top Layer w0.508: U1.25 83.66,41.56 82.61,41.56 81.21,42.96 81.21,44.61 75.76,50.06 75.76,57.51 70.71,62.56 60.36,62.56 54.71,68.21 54.71,71.56
A_TR8: length 52.8
  Top Layer w0.508: 52.17,71.56 52.17,68.75 59.36,61.56 70.11,61.56 74.91,56.76 74.91,49.41 80.16,44.16 80.16,41.46 82.78,38.84 U1.26
AIN1: length 103.2
  Top Layer w0.508: 37.08,44.23 37.25,44.06 41.01,44.06 43.36,41.71 43.36,35.86 53.51,25.71 71.71,25.71 77.71,19.71 84.76,19.71 90.74,25.69 90.74,50.28 92,51.54 U1.10
AIN2: length 106
  Top Layer w0.508: 37.08,46.77 40.95,46.77 44.46,43.26 44.46,36.46 53.96,26.96 72.21,26.96 78.56,20.61 83.76,20.61 89.61,26.46 89.61,52.53 91.15,54.08 U1.11
AO1: length 25.6
  Top Layer w1.27: 19.6,22.52 18.6,22.52 15.39,25.73 15.39,37.69 19.39,41.69 21.84,41.69
AO2: length 30.6
  Top Layer w1.27: 19.6,14.52 20.27,14.52 22.71,16.96 22.71,23.61 18.16,28.16 18.16,36.91 20.4,39.15 21.84,39.15
BIN1: length 96.1
  Top Layer w0.508: 37.08,39.15 37.14,39.21 39.11,39.21 41.16,37.16 41.16,34.81 52.61,23.36 70.76,23.36 76.41,17.71 85.81,17.71 92.86,24.76 92.86,45.06 94.26,46.46 U1.8
BIN2: length 93.2
  Top Layer w0.508: 37.11,36.6 39.19,36.6 40.14,35.65 40.14,34.25 52.09,22.3 70.44,22.3 76.04,16.7 86.39,16.7 93.89,24.2 93.89,42.7 95.1,43.91 99.11,43.91
BO1: length 96
  Top Layer w1.27: 21.84,36.61 27.21,36.61 30.3,33.52 30.3,29.97 47.15,13.12 63.9,13.12 66.52,10.51 88.41,10.51 91.06,13.16 102.51,13.16 U12.1
BO2: length 114.8
  Top Layer w1.27: 21.84,34.07 24,34.07 24,33.96 26.16,33.96 27.36,32.76 27.36,28.86 v1(46.16,10.06) 61.46,10.06 64.06,7.46 v1(74.08,7.46) v1(74.84,7.46) v1(75.6,7.46) v1(76.37,7.46) v1(77.13,7.46) v1(84.15,7.46) v1(84.91,7.46) v1(85.67,7.46) v1(86.43,7.46) v1(87.19,7.46) 90.01,7.46 92.96,10.41 104.81,10.41 108.21,13.81 108.21,19.16 104.87,22.5 U12.2
  vias: v1(44.37,10.1) v1(44.37,9.34) v1(45.13,10.1) v1(45.13,9.34) v1(45.89,9.34) v1(46.65,9.34) v1(47.42,10.06) v1(47.42,9.34) v1(48.07,8.59) v1(48.07,7.83) v1(48.1,7.01) v1(48.1,6.25) v1(48.84,8.59) v1(48.84,7.83) v1(48.86,7.01) v1(48.86,6.25) v1(49.6,8.59) v1(49.6,7.83) v1(49.63,7.01) v1(49.63,6.25) v1(50.36,8.59) v1(50.36,7.83) v1(50.39,7.01) v1(50.39,6.25) v1(51.12,8.59) v1(51.12,7.83) v1(51.15,7.01) v1(51.15,6.25) v1(51.93,7) v1(51.93,6.24) v1(52.01,8.61) v1(52.01,7.84) v1(52.69,7) v1(52.69,6.24) v1(52.77,8.61) v1(52.77,7.84) v1(53.45,7) v1(53.45,6.24) v1(53.53,8.61) v1(53.53,7.84) v1(54.3,8.61) v1(54.3,7.84) v1(54.22,7) v1(54.22,6.24) v1(54.98,7) v1(54.98,6.24) v1(55.06,8.61) v1(55.06,7.84) v1(55.85,7.02) v1(55.85,6.26) v1(55.93,8.64) v1(55.93,7.88) v1(56.69,8.64) v1(56.69,7.88) v1(56.62,7.02) v1(56.62,6.26) v1(57.38,7.02) v1(57.38,6.26) v1(57.45,8.64) v1(57.45,7.88) v1(58.14,7.02) v1(58.14,6.26) v1(58.21,8.64) v1(58.21,7.88) v1(58.9,7.02) v1(58.9,6.26) v1(58.98,8.64) v1(58.98,7.88) v1(59.9,8.77) v1(59.9,8.01) v1(59.81,7.08) v1(59.81,6.32) v1(60.57,7.08) v1(60.57,6.32) v1(60.66,8.77) v1(60.66,8.01) v1(61.34,7.08) v1(61.34,6.32) v1(61.43,8.77) v1(61.43,8.01) v1(62.1,7.08) v1(62.1,6.32) v1(62.19,8.01) v1(62.47,9.05) v1(62.85,8.67) v1(62.86,7.08) v1(62.86,6.32) v1(63.23,8.29) v1(64.77,7.46) v1(64.77,6.49) v1(65.53,7.46) v1(65.53,6.49) v1(66.29,7.46) v1(66.29,6.49) v1(67.05,7.46) v1(67.05,6.49) v1(67.81,7.46) v1(67.81,6.49) v1(69.51,7.46) v1(69.51,6.59) v1(70.27,7.46) v1(70.27,6.59) v1(71.03,7.46) v1(71.03,6.59) v1(71.79,7.46) v1(71.79,6.59) v1(72.56,7.46) v1(72.56,6.59) v1(74.08,6.7) v1(74.84,6.7) v1(75.6,6.7) v1(76.37,6.7) v1(77.13,6.7) v1(79.24,7.46) v1(79.24,6.59) v1(80.01,7.46) v1(80.01,6.59) v1(80.77,7.46) v1(80.77,6.59) v1(81.53,7.46) v1(81.53,6.59) v1(82.29,7.46) v1(82.29,6.59) v1(84.15,6.7) v1(84.91,6.7) v1(85.67,6.7) v1(86.43,6.7) v1(87.2,6.7)
BUTTON: length 14.7
  Top Layer w1.016: R14.2 108.71,39.76 109.31,39.16 KEY2.2 ; 108.61,39.01 99.45,39.01 99.13,38.69
BUZZER: length 92.6
  Top Layer w1.27: R19.2 24.06,61.11 v3(24.06,64.96)
  Bottom Layer w1.27: v3(24.06,64.96) 24.06,64.46 37.66,64.46 39.56,62.56 39.56,59.61 41.35,57.82 42.21,56.96 46.02,56.96 56.62,67.56 85.51,67.56 93.91,59.16 U1.13
C_GND: length 129.1
  Top Layer w0.508: R3.2 v1(80.26,79.73) R2.1 ; 70.16,78.02 v1(70.16,79.84) 70.16,84.51 69.25,85.42 67.16,85.42 67.16,86.41 66.51,87.06 63.51,87.06 62.56,86.11 R9.2 R10.2 59.76,84.16 58.36,85.56 R11.1 ; R15.1 R18.2 ; 57.5,85.56 57.5,87.02 56.91,87.61 54.21,87.61 52.36,85.76 ; 42.06,82.02 v1(42.06,79.94) 42.06,77.82 ; R4.2 v1(90.36,79.74) R1.1 ; 52.36,78.02 52.36,82.02
  Top Layer w0.762: P2.10 49.33,88.79 52.36,85.76 52.36,82.02
  Bottom Layer w0.635: v1(70.16,79.84) 70.16,79.26 73.16,76.26 78.31,76.26 80.26,78.21 ; v1(52.31,80.06) 52.56,79.81 52.56,78.56 50.21,76.21 43.61,76.21 42.06,77.76 v1(42.06,79.94) 42.06,78.96 39.26,76.16 33.76,76.16 32.06,77.86 v1(32.06,79.91) ; v1(90.36,79.74) 90.41,79.69 90.41,78.26 88.46,76.31 82.16,76.31 80.26,78.21 ; 80.26,78.21 v1(80.26,79.73)
C_VCC: length 147.3
  Top Layer w0.381: 54.81,76.11 60.31,76.11 61.16,76.96 61.16,78.76 61.51,79.11 65.26,79.11 U5.1 ; U5.3 68.51,80.81 68.51,76.91 69.11,76.31 70.81,76.31 71.16,76.66 71.16,79.66 71.61,80.11 74.31,80.11 75.26,79.16
  Top Layer w0.508: 87.73,84.41 78.66,84.41 77.06,82.81 U4.3 77.06,80.96 75.26,79.16 U4.1 ; 44.51,76.11 54.81,76.11 55.28,76.58 U6.1 55.28,79.23 57.08,81.03 U6.3 ; 34.31,76.16 25.81,76.16 25.26,76.71 U13.1 25.26,78.81 27.06,80.61 U13.3 ; 34.31,76.16 35.26,77.11 U9.1 35.26,78.76 37.06,80.56 U9.3 ; 34.31,76.16 44.51,76.16 45.26,76.91 U7.1 45.26,78.81 47.06,80.61 U7.3 ; U3.1 85.26,79.31 87.06,81.11 U3.3 86.91,82.41 86.91,83.86 87.46,84.41 96.56,84.41 97.06,83.91 U2.3 97.06,80.76 95.26,78.96 U2.1 ; U5.1 65.26,79.41 67.06,81.21 U5.3 ; 81.13,84.41 81.13,87.54 77.91,90.76 P2.1
D2_2: length 7
  Top Layer w1.27: 24.96,5.31 v1(24.96,7.09) v1(24.96,7.88) v1(24.96,8.76) v1(25.59,9.4) v1(26.21,10.01) 27.89,10.01 27.99,10.11
EDF27: length 56.9
  Top Layer w1.016: U1.14 102.02,61.7 v1(107.81,55.91) v1(108.49,55.23) v1(109.01,54.71) v1(109.57,54.15) v1(110.2,53.52) v1(111.1,52.62) v1(111.66,52.06) v1(111.66,51.03) v1(111.66,49.78) v1(111.66,48.73) v1(111.66,47.88) v1(111.66,46.67) 111.66,31.71 105.81,25.86 100.52,25.86 96.01,21.35
  vias: v1(106.97,54.14) v1(106.97,53.38) v1(106.97,52.61) v1(106.97,51.68) v1(106.97,50.92) v1(106.97,50.16) v1(107.74,54.14) v1(107.74,53.38) v1(107.74,52.61) v1(107.73,51.68) v1(107.73,50.92) v1(107.73,50.16) v1(108.59,48.78) v1(108.59,48.02) v1(109.36,48.78) v1(109.36,48.02) v1(110.12,48.78) v1(110.12,48.02)
EMIT: length 12.4
  Top Layer w1.016: U1.15 93.86,69.46 R20.2
P1_1: length 14.8
  Top Layer w1.27: S1.2 v1(22.96,10.16) v1(22.96,10.92) v1(22.96,11.69) v1(22.96,12.45) v1(22.96,13.21) v1(26.71,16.96) P1.1
  vias: v1(23.34,13.59) v1(25.85,16.1) v1(26.2,14.98) v1(26.2,14.22) v1(26.2,13.46) v1(26.23,16.48) v1(26.96,15.74) v1(26.96,14.98) v1(26.96,14.22) v1(26.96,13.46) v1(27.86,14.96) v1(27.86,14.2) v1(28.62,14.96) v1(28.62,14.2) v1(29.39,14.96) v1(29.39,14.2) v1(30.2,18.88) v1(30.2,18.11) v1(30.2,17.35) v1(30.2,16.59) v1(30.2,15.83) v1(30.15,14.96) v1(30.15,14.2) v1(30.96,18.88) v1(30.96,18.11) v1(30.96,17.35) v1(30.96,16.59) v1(30.96,15.83) v1(30.91,14.96) v1(30.91,14.2)
P3_10: length 11.2
  Top Layer w0.762: 80.66,70.36 79.96,71.06 79.96,72.65 79.15,73.46 74.39,73.46 72.49,71.56
PWMA: length 109.2
  Top Layer w0.508: U1.12 90.12,56.62 88.21,54.7 88.21,27.16 82.76,21.71 78.96,21.71 72.46,28.21 54.51,28.21 45.61,37.11 45.61,45.86 42.16,49.31 37.08,49.31
PWMB: length 90.2
  Top Layer w0.508: U1.6 95.97,41.38 95.31,40.72 95.31,23.86 87.11,15.66 75.41,15.66 69.81,21.26 51.46,21.26 38.65,34.07 37.08,34.07
Q1_2: length 6.4
  Top Layer w0.762: Q1.2 20.81,56.11 20.81,59.16 21.56,59.91 R19.1
Q1_3: length 15.7
  Top Layer w0.762: Q1.3 23.16,57.21 26.66,57.21 27.82,56.05 32.95,56.05 35.66,58.76 35.66,59.46
Q2_2: length 3
  Top Layer w0.762: R20.1 86.81,69.41 Q2.2
R11_2: length 3.3
  Top Layer w0.508: U6.2 55.16,82.38 R11.2
R12_2: length 3.2
  Top Layer w0.508: U5.2 65.16,82.36 65.16,85.42
R13_2: length 5.1
  Top Layer w1.016: 13.97,49.36 13.96,44.21
RXD: length 31.6
  Bottom Layer w0.762: B1.5 99.23,8.18 102.46,11.41 103.36,11.41 105.96,14.01 105.96,26.21 103.49,28.68 U1.1
STBY: length 99.7
  Top Layer w0.508: 37.08,41.69 37.11,41.66 40.06,41.66 42.21,39.51 42.21,35.36 52.96,24.61 71.16,24.61 77.01,18.76 85.26,18.76 91.91,25.41 91.91,48.02 92.89,49 U1.9
TR1: length 43
  Top Layer w0.508: R4.1 92.36,76.91 93.21,76.06 96.51,76.06 97.06,76.61 U2.4
  Bottom Layer w0.635: 69.65,90.76 69.86,90.55 69.86,89.46 71.56,87.76 73.81,87.76 75.31,89.26 78.86,89.26 83.51,84.61 88.41,84.61 93.11,79.91 96.44,79.91 97.06,79.29 U2.4
TR2: length 34.2
  Top Layer w0.508: 82.26,77.92 82.26,76.66 82.61,76.31 86.61,76.31 87.06,76.76 U3.4
  Bottom Layer w0.635: 67.11,90.76 67.11,90.06 73.01,84.16 78.71,84.16 82.91,79.96 86.66,79.96 87.06,79.56 U3.4
TR3: length 28.5
  Top Layer w0.508: U4.4 77.06,76.56 76.66,76.16 72.61,76.16 72.16,76.61 72.16,78.02
  Bottom Layer w0.635: U4.4 77.26,78.16 77.26,79.61 76.76,80.11 72.81,80.11 64.57,88.35 P2.4
TR4: length 24.1
  Top Layer w0.508: R9.1 62.56,77.21 63.61,76.16 66.51,76.16 67.06,76.71 U5.4
  Bottom Layer w0.635: U5.4 67.01,78.01 67.01,79.61 66.36,80.26 63.06,80.26 62.03,81.29 62.03,90.76
TR5: length 18.7
  Top Layer w0.508: U6.4 57.23,78.12 R10.1
  Bottom Layer w0.635: U6.4 57.23,78.11 59.56,78.11 60.46,79.01 60.46,83.41 59.49,84.38 P2.6
TR6: length 22
  Top Layer w0.508: U7.4 47.11,78.02 50.36,78.02
  Bottom Layer w0.635: 56.95,90.76 56.95,88.35 54.36,85.76 52.51,85.76 50.11,83.36 50.11,79.76 48.31,77.96 U7.4
TR7: length 27.2
  Top Layer w0.508: 40.06,77.82 37.1,77.82 U9.4
  Bottom Layer w0.635: 54.41,90.76 54.41,88.46 53.61,87.66 51.51,87.66 48.01,84.16 44.11,84.16 40.51,80.56 40.51,80.31 38.06,77.86 U9.4
TR8: length 36.1
  Top Layer w0.508: U13.4 27.1,77.82 R18.1
  Bottom Layer w0.762: 51.87,90.76 51.87,91.92 50.33,93.46 48.31,93.46 45.61,90.76 42.96,90.76 36.81,84.61 34.11,84.61 32.16,82.66 32.11,82.66 27.31,77.86 U13.4
TXD: length 34.1
  Bottom Layer w0.762: 101.77,5.79 101.77,7.47 107.76,13.46 107.76,27.01 103.55,31.22 U1.2
U2_2: length 2.9
  Top Layer w0.508: U2.2 95.22,82.22 R1.2
U3_2: length 3
  Top Layer w0.508: U3.2 85.22,82.22 R2.2
U4_2: length 3.1
  Top Layer w0.508: U4.2 75.2,82.32 72.16,82.32
U7_2: length 8.4
  Top Layer w0.635: U7.2 45.26,83.56 45.96,84.26 49.51,84.26 50.36,83.41 50.36,82.02
U9_2: length 8.5
  Top Layer w0.635: 40.06,82.02 40.06,83.71 39.56,84.21 35.71,84.21 35.26,83.76 U9.2
U13_2: length 8.6
  Top Layer w0.635: R15.2 30.06,83.91 29.71,84.26 25.71,84.26 25.26,83.81 U13.2
VM: length 156.7
  Top Layer w1.016: U8.1 21.79,49.36 LED1.A
  Bottom Layer w1.27: U1.30 80.39,28.68 78.41,30.66 v1(77.2,30.66) v1(76.44,30.66) v1(75.68,30.66) 72.06,30.66 69.56,28.16 54.41,28.16 46.76,20.51 40.76,20.51 29.56,31.71 29.56,45.11 25.36,49.31 21.84,49.31
  Bottom Layer w1.778: 10.82,35.7 10.82,38.78 12.77,40.73 13.36,40.73 ; 10.82,35.7 10.82,34.55 v1(11.98,33.39) ; 10.82,35.7 v1(10.62,35.51) ; v1(11.98,33.39) 12.85,31.92 12.85,31.16 ; v1(11.98,33.39) 11.98,38.67 12.34,39.03 ; 17.83,10.11 v1(12.85,15.09) 12.85,42.7 19.46,49.31 21.84,49.31
  vias: v1(9.86,37.79) v1(9.86,37.03) v1(9.86,36.27) v1(9.86,35.51) v1(9.86,34.75) v1(10.11,21.09) v1(10.11,20.33) v1(10.11,19.56) v1(10.11,18.8) v1(10.11,18.04) v1(10.35,33.67) v1(10.35,32.91) v1(10.35,32.15) v1(10.35,31.39) v1(10.35,30.62) v1(10.35,29.79) v1(10.35,29.03) v1(10.35,28.27) v1(10.35,27.5) v1(10.35,26.74) v1(10.44,25.6) v1(10.44,24.84) v1(10.44,24.08) v1(10.44,23.32) v1(10.44,22.56) v1(10.62,37.79) v1(10.62,37.03) v1(10.62,36.27) v1(10.62,34.75) v1(10.88,21.09) v1(10.88,20.33) v1(10.88,19.56) v1(10.88,18.8) v1(10.88,18.04) v1(11.11,32.91) v1(11.11,32.15) v1(11.11,31.39) v1(11.11,30.62) v1(11.11,29.79) v1(11.11,29.03) v1(11.11,28.27) v1(11.11,27.5) v1(11.11,26.74) v1(11.2,25.6) v1(11.2,24.84) v1(11.2,24.08) v1(11.2,23.32) v1(11.2,22.56) v1(11.38,37.79) v1(11.38,37.03) v1(11.38,36.27) v1(11.38,35.51) v1(11.38,34.75) v1(11.98,36.18) v1(11.98,35.42) v1(11.98,34.66) v1(11.98,33.67) v1(12.35,32.76) v1(12.34,31.92) v1(12.34,31.16) v1(12.34,30.4) v1(12.34,29.63) v1(12.34,28.87) v1(12.34,28.11) v1(12.34,27.35) v1(12.34,26.59) v1(12.34,25.82) v1(12.34,25.06) v1(12.85,36.18) v1(12.85,35.42) v1(12.85,34.66) v1(12.85,33.9) v1(12.85,19.44) v1(12.85,19.44) v1(12.85,18.68) v1(12.85,18.68) v1(12.85,17.92) v1(12.85,17.92) v1(12.85,17.16) v1(12.85,17.16) v1(12.85,16.39) v1(12.85,16.39) v1(13.1,31.92) v1(13.1,31.16) v1(13.1,30.4) v1(13.1,29.63) v1(13.1,28.87) v1(13.1,28.11) v1(13.1,27.35) v1(13.1,26.59) v1(13.1,25.82) v1(13.1,25.06) v1(13.55,12.58) v1(13.69,14.25) v1(13.69,14.25) v1(14.07,13.87) v1(14.07,13.87) v1(14.21,20.01) v1(14.21,19.25) v1(14.21,18.48) v1(14.21,17.72) v1(14.21,16.96) v1(14.31,15.63) v1(14.31,12.58) v1(14.45,13.49) v1(14.91,13.03) v1(14.97,20.01) v1(14.97,19.25) v1(14.97,18.48) v1(14.97,17.72) v1(14.97,16.96) v1(15.29,12.65) v1(15.43,15.84) v1(15.43,15.08) v1(15.43,14.32) v1(15.67,12.27) v1(16.19,15.84) v1(16.19,15.08) v1(16.19,14.32) v1(16.19,13.55) v1(30.39,46.08) v1(30.39,45.32) v1(30.39,44.56) v1(31.15,46.08) v1(31.15,45.32) v1(31.15,44.56) v1(47.21,20.96) v1(47.36,22.34) v1(47.59,21.34) v1(47.97,21.72) v1(48.12,20.81) v1(48.35,22.1) v1(49.42,19.8) v1(49.42,19.04) v1(49.42,18.28) v1(50.19,19.8) v1(50.19,19.04) v1(50.19,18.28) v1(75.68,31.42) v1(75.66,29.38) v1(75.66,28.62) v1(76.44,31.42) v1(76.42,29.38) v1(76.42,28.62) v1(77.2,31.42) v1(77.19,29.38) v1(77.19,28.62)

## Copper pours and planes (outline as drawn; the poured copper is in the pictures)
GND on Top Layer: -1.37,114.98 -0.61,115.74 120.55,115.74 123.34,112.95 123.34,-1.86 122.32,-2.88 -3.91,-2.88
GND on Top Layer: 20.47,32.43 28.34,32.43 28.34,22.78 20.47,22.78
GND on Top Layer: 3.96,38.52 6.75,38.52 6.75,34.21 3.96,34.21
GND on Bottom Layer: 0.66,113.96 1.42,114.72 122.58,114.72 125.37,111.93 125.37,-2.88 124.36,-3.89 -1.88,-3.89
VCC on Top Layer: 27.84,73.32 50.7,73.32 50.7,58.08 27.84,58.08
AIN1 on Top Layer: 96.42,52.49 100.48,52.49 100.48,50.72 96.42,50.72
AIN2 on Top Layer: 96.42,55.03 100.48,55.03 100.48,53.26 96.42,53.26
BIN1 on Top Layer: 96.42,47.41 100.48,47.41 100.48,45.64 96.42,45.64
BIN2 on Top Layer: 96.42,44.87 100.48,44.87 100.48,43.1 96.42,43.1
BO2 on Top Layer: 36.99,19.15 93.88,19.15 93.88,5.68 36.99,5.68
EDF27 on Top Layer: 98.96,62.65 112.16,62.65 112.16,42.08 98.96,42.08
P1_1 on Top Layer: 22.25,19.47 31.9,19.47 31.9,10.84 22.25,10.84
PWMA on Top Layer: 96.42,57.57 100.48,57.57 100.48,55.8 96.42,55.8
PWMB on Top Layer: 96.42,42.33 100.48,42.33 100.48,40.56 96.42,40.56
Q1_3 on Top Layer: 27.58,60.62 36.73,60.62 36.73,56.05 27.58,56.05
STBY on Top Layer: 96.42,49.95 100.48,49.95 100.48,48.18 96.42,48.18
VM on Top Layer: 9.29,38.52 12.09,38.52 12.09,33.95 9.29,33.95
VM on Top Layer: 9.55,39.29 17.83,39.29 17.83,9.82 9.55,9.82
VM on Bottom Layer: 21.84,49.95 85.24,49.95 85.24,14.9 21.84,14.9

## Text on the board
Bottom Silkscreen Layer: electronics@elec.mn | Designed by: Enkhbold
Top Solder Mask Layer: BAT LED | Piezo | Designed by: Enkhbold | EDF27
Top Silkscreen Layer: AO2 | AO1 | BO2 | BO1 | + NC - | Tattu 2S 7.4V 75C | Dim:15x16x61mm | Weight:37g | ZIPTIE | V1.3 | 2020.OCT.21 | ДААГА РОБОТ
